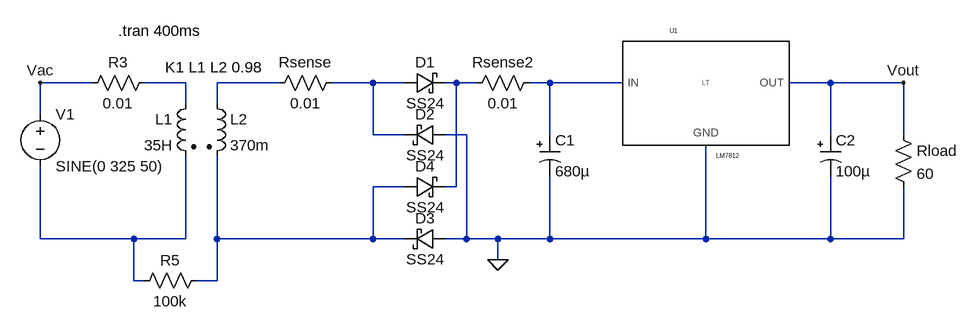
[diagram p0: schematic transformer2.asc]
transformer2.asc, the LTspice schematic file:
Version 4
SHEET 1 1904 680
WIRE 48 64 -32 64
WIRE 192 64 128 64
WIRE 336 64 240 64
WIRE 480 64 416 64
WIRE 528 64 480 64
WIRE 608 64 592 64
WIRE 640 64 608 64
WIRE 752 64 720 64
WIRE 864 64 752 64
WIRE 1184 64 1120 64
WIRE 1296 64 1184 64
WIRE 192 96 192 64
WIRE 240 96 240 64
WIRE -32 112 -32 64
WIRE 480 144 480 64
WIRE 528 144 480 144
WIRE 624 144 592 144
WIRE 752 144 752 64
WIRE 1184 144 1184 64
WIRE 1296 144 1296 64
WIRE 528 224 480 224
WIRE 608 224 608 64
WIRE 608 224 592 224
WIRE -32 304 -32 192
WIRE 112 304 -32 304
WIRE 192 304 192 176
WIRE 192 304 112 304
WIRE 240 304 240 176
WIRE 480 304 480 224
WIRE 480 304 240 304
WIRE 528 304 480 304
WIRE 624 304 624 144
WIRE 624 304 592 304
WIRE 672 304 624 304
WIRE 752 304 752 208
WIRE 752 304 672 304
WIRE 992 304 992 160
WIRE 992 304 752 304
WIRE 1184 304 1184 208
WIRE 1184 304 992 304
WIRE 1296 304 1296 224
WIRE 1296 304 1184 304
WIRE 672 336 672 304
WIRE 112 368 112 304
WIRE 128 368 112 368
WIRE 240 368 240 304
WIRE 240 368 208 368
FLAG 672 336 0
FLAG -32 64 Vac
FLAG 1296 64 Vout
SYMBOL ind2 224 80 R0
SYMATTR InstName L2
SYMATTR Value 370m
SYMATTR Type ind
SYMATTR SpiceLine Rser=22.7m
SYMBOL ind2 208 80 M0
SYMATTR InstName L1
SYMATTR Value 35H
SYMATTR Type ind
SYMATTR SpiceLine Rser=3.5k
SYMBOL voltage -32 96 R0
WINDOW 123 0 0 Left 2
WINDOW 39 0 0 Left 2
SYMATTR InstName V1
SYMATTR Value SINE(0 325 50)
SYMBOL schottky 528 80 R270
WINDOW 0 32 32 VTop 2
WINDOW 3 0 32 VBottom 2
SYMATTR InstName D1
SYMATTR Value SS24
SYMATTR Description Diode
SYMATTR Type diode
SYMBOL schottky 592 128 R90
WINDOW 0 0 32 VBottom 2
WINDOW 3 32 32 VTop 2
SYMATTR InstName D2
SYMATTR Value SS24
SYMATTR Description Diode
SYMATTR Type diode
SYMBOL schottky 592 288 R90
WINDOW 0 0 32 VBottom 2
WINDOW 3 32 32 VTop 2
SYMATTR InstName D3
SYMATTR Value SS24
SYMATTR Description Diode
SYMATTR Type diode
SYMBOL schottky 528 240 R270
WINDOW 0 32 32 VTop 2
WINDOW 3 0 32 VBottom 2
SYMATTR InstName D4
SYMATTR Value SS24
SYMATTR Description Diode
SYMATTR Type diode
SYMBOL polcap 736 144 R0
WINDOW 3 24 56 Left 2
SYMATTR Value 680µ
SYMATTR InstName C1
SYMATTR Description Capacitor
SYMATTR Type cap
SYMATTR SpiceLine V=50 Irms=1.47 Rser=0.053 Lser=0
SYMBOL res 432 48 R90
WINDOW 0 0 56 VBottom 2
WINDOW 3 32 56 VTop 2
SYMATTR InstName Rsense
SYMATTR Value 0.01
SYMBOL res 144 48 R90
WINDOW 0 0 56 VBottom 2
WINDOW 3 32 56 VTop 2
SYMATTR InstName R3
SYMATTR Value 0.01
SYMBOL res 224 352 R90
WINDOW 0 0 56 VBottom 2
WINDOW 3 32 56 VTop 2
SYMATTR InstName R5
SYMATTR Value 100k
SYMBOL res 1280 128 R0
SYMATTR InstName Rload
SYMATTR Value 60
SYMBOL res 624 80 R270
WINDOW 0 32 56 VTop 2
WINDOW 3 0 56 VBottom 2
SYMATTR InstName Rsense2
SYMATTR Value 0.01
SYMBOL my\\7812 992 64 R0
SYMATTR InstName U1
SYMBOL polcap 1168 144 R0
WINDOW 3 24 56 Left 2
SYMATTR Value 100µ
SYMATTR InstName C2
SYMATTR Description Capacitor
SYMATTR Type cap
SYMATTR SpiceLine V=50 Irms=1.47 Rser=0.053 Lser=0
TEXT 160 40 Left 2 !K1 L1 L2 0.98
TEXT 88 -16 Left 2 !.tran 400ms

The netlist it stands for:
* transformer2.asc
L2 N002 N006 370m Rser=22.7m
L1 N001 N007 35H Rser=3.5k
V1 Vac N007 SINE(0 325 50)
D1 N003 N004 SS24
D2 0 N003 SS24
D3 0 N006 SS24
D4 N006 N004 SS24
C1 N005 0 680µ V=50 Irms=1.47 Rser=0.053 Lser=0
Rsense N003 N002 0.01
R3 N001 Vac 0.01
R5 N006 N007 100k
Rload Vout 0 60
Rsense2 N004 N005 0.01
XU1 N005 0 Vout LM7812  ; pins IN GND OUT
C2 Vout 0 100µ V=50 Irms=1.47 Rser=0.053 Lser=0
.model D D
.lib standard.dio
K1 L1 L2 0.98
.tran 400ms
.lib regulators.lib
.backanno
.end